# Altium project Lab_5.PrjPcb
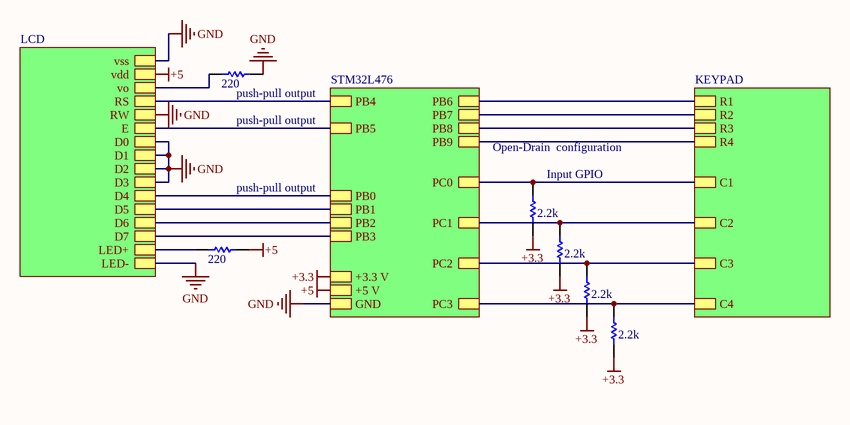
[diagram p0: Lab_5.SchDoc]
3 sheets, 11 parts. Net scope: hierarchical (ports join the sheet entries above them; power ports are global).
Sheets:
  Lab_5.SchDoc
  Lab_7.SchDoc
  Lab_8.SchDoc

## Sheet Lab_5.SchDoc
size A; SheetNumber: 1; SheetTotal: 1

### Parts
(Parts that share a designator on the sheet are numbered #1, #2 ... from top to bottom, then left to right.)
?#1  value 220  (hidden comment: Resistor)
?#2  value 2.2k  (hidden comment: Resistor)
?#3  value 220  (hidden comment: Resistor)
?#4  value 2.2k  (hidden comment: Resistor)
?#5  value 2.2k  (hidden comment: Resistor)
?#6  value 2.2k  (hidden comment: Resistor)

### Sub-sheets
KEYPAD = File Name (file not in this document): R1, R2, R3, R4, C1, C2, C3, C4
LCD = File Name (file not in this document): LED-, LED+, D7, D6, D5, D4, D3, D2, D1, D0, E, RW, RS, vo, vdd, vss
STM32L476 = File Name (file not in this document): PB0, PB1, PB2, PB3, PB4, PB5, PB6, PB7, PB8, PB9, PC0, PC1, PC2, PC3, +3.3 V, +5 V, GND

### Nets
+3.3: ?#2.1 ?#4.1 ?#5.1 ?#6.1 ; sheet STM32L476/+3.3 V
+5: ?#3.2 ; sheet STM32L476/+5 V, sheet LCD/vdd
GND: ?#1.2 ; sheet STM32L476/GND, sheet LCD/LED-, sheet LCD/D3, sheet LCD/D2, sheet LCD/D1, sheet LCD/D0, sheet LCD/RW, sheet LCD/vss
Net?#1_1: ?#1.1 ; sheet LCD/vo
Net?#2_2: ?#2.2 ; sheet STM32L476/PC0, sheet KEYPAD/C1
Net?#3_1: ?#3.1 ; sheet LCD/LED+
Net?#4_2: ?#4.2 ; sheet STM32L476/PC1, sheet KEYPAD/C2
Net?#5_2: ?#5.2 ; sheet STM32L476/PC2, sheet KEYPAD/C3
Net?#6_2: ?#6.2 ; sheet STM32L476/PC3, sheet KEYPAD/C4
(unnamed): sheet STM32L476/PB0, sheet LCD/D4
(unnamed): sheet STM32L476/PB1, sheet LCD/D5
(unnamed): sheet STM32L476/PB2, sheet LCD/D6
(unnamed): sheet STM32L476/PB3, sheet LCD/D7
(unnamed): sheet STM32L476/PB4, sheet LCD/RS
(unnamed): sheet STM32L476/PB5, sheet LCD/E
(unnamed): sheet STM32L476/PB6, sheet KEYPAD/R1
(unnamed): sheet STM32L476/PB7, sheet KEYPAD/R2
(unnamed): sheet STM32L476/PB8, sheet KEYPAD/R3
(unnamed): sheet STM32L476/PB9, sheet KEYPAD/R4

### Notes on the sheet
- push-pull output
- (near ?#2) Open-Drain  configuration
- (near ?#2) Input GPIO

### Library data of the parts
?#1-?#6 = Resistor: TC1: 0; SimulationGenericComponent: True; TC2: 0

## Sheet Lab_7.SchDoc
size A; SheetNumber: 2; SheetTotal: 3
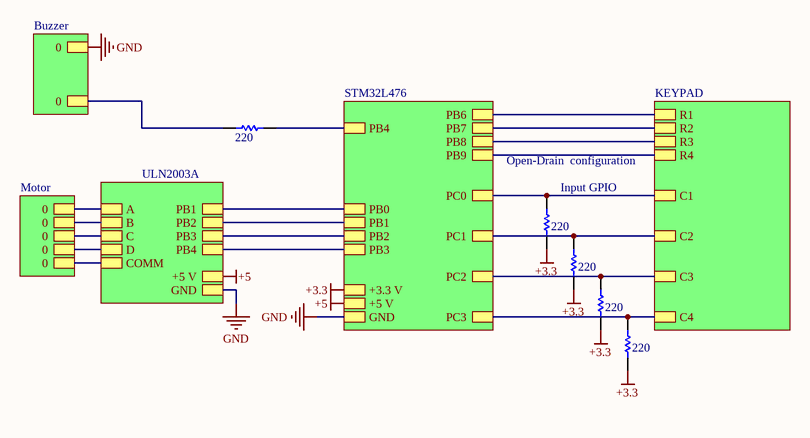
[diagram p1: Lab_7.SchDoc]

### Parts
(Parts that share a designator on the sheet are numbered #1, #2 ... from top to bottom, then left to right.)
?#7  value 220  (hidden comment: Resistor)
?#8  value 220  (hidden comment: Resistor)
?#9  value 220  (hidden comment: Resistor)
?#10  value 220  (hidden comment: Resistor)
?#11  value 220  (hidden comment: Resistor)

### Sub-sheets
Buzzer = File Name (file not in this document): 0, 0
KEYPAD = File Name (file not in this document): R1, R2, R3, R4, C1, C2, C3, C4
Motor = File Name (file not in this document): 0, 0, 0, 0, 0
STM32L476 = File Name (file not in this document): PB0, PB1, PB2, PB3, PB4, PB6, PB7, PB8, PB9, PC0, PC1, PC2, PC3, +3.3 V, +5 V, GND
ULN2003A = File Name (file not in this document): PB1, PB2, PB3, PB4, A, B, C, D, COMM, +5 V, GND

### Nets
+3.3: ?#8.1 ?#9.1 ?#10.1 ?#11.1 ; sheet STM32L476/+3.3 V
+5: sheet STM32L476/+5 V, sheet ULN2003A/+5 V
GND: sheet STM32L476/GND, sheet Buzzer/0, sheet ULN2003A/GND
Net?#7_1: ?#7.1 ; sheet STM32L476/PB4
Net?#7_2: ?#7.2 ; sheet Buzzer/0
Net?#8_2: ?#8.2 ; sheet STM32L476/PC0, sheet KEYPAD/C1
Net?#9_2: ?#9.2 ; sheet STM32L476/PC1, sheet KEYPAD/C2
Net?#10_2: ?#10.2 ; sheet STM32L476/PC2, sheet KEYPAD/C3
Net?#11_2: ?#11.2 ; sheet STM32L476/PC3, sheet KEYPAD/C4
(unnamed): sheet STM32L476/PB0, sheet ULN2003A/PB1
(unnamed): sheet STM32L476/PB1, sheet ULN2003A/PB2
(unnamed): sheet STM32L476/PB2, sheet ULN2003A/PB3
(unnamed): sheet STM32L476/PB3, sheet ULN2003A/PB4
(unnamed): sheet STM32L476/PB6, sheet KEYPAD/R1
(unnamed): sheet STM32L476/PB7, sheet KEYPAD/R2
(unnamed): sheet STM32L476/PB8, sheet KEYPAD/R3
(unnamed): sheet STM32L476/PB9, sheet KEYPAD/R4
(unnamed): sheet ULN2003A/A, sheet Motor/0
(unnamed): sheet ULN2003A/B, sheet Motor/0
(unnamed): sheet ULN2003A/C, sheet Motor/0
(unnamed): sheet ULN2003A/D, sheet Motor/0
(unnamed): sheet ULN2003A/COMM, sheet Motor/0

### Notes on the sheet
- (near ?#8) Open-Drain  configuration
- (near ?#8) Input GPIO

### Library data of the parts
?#7-?#11 = Resistor: TC1: 0; SimulationGenericComponent: True; TC2: 0

## Sheet Lab_8.SchDoc
size A; SheetNumber: 4; SheetTotal: 4
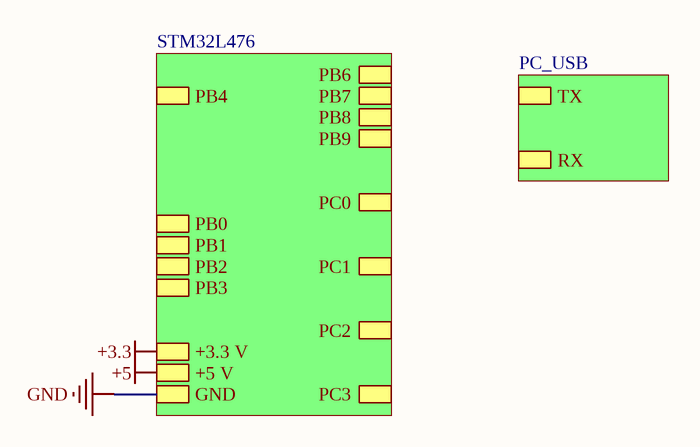
[diagram p2: Lab_8.SchDoc]

### Sub-sheets
PC_USB = File Name (file not in this document): TX, RX
STM32L476 = File Name (file not in this document): PB0, PB1, PB2, PB3, PB4, PB6, PB7, PB8, PB9, PC0, PC1, PC2, PC3, +3.3 V, +5 V, GND

## Nets that join several sheets
+3.3: Lab_5 (?#2.1 ?#4.1 ?#5.1 ?#6.1), Lab_7 (?#8.1 ?#9.1 ?#10.1 ?#11.1)